# Altium schematic sheet Sheet1.SchDoc
size A4; SheetNumber: 1; SheetTotal: 1
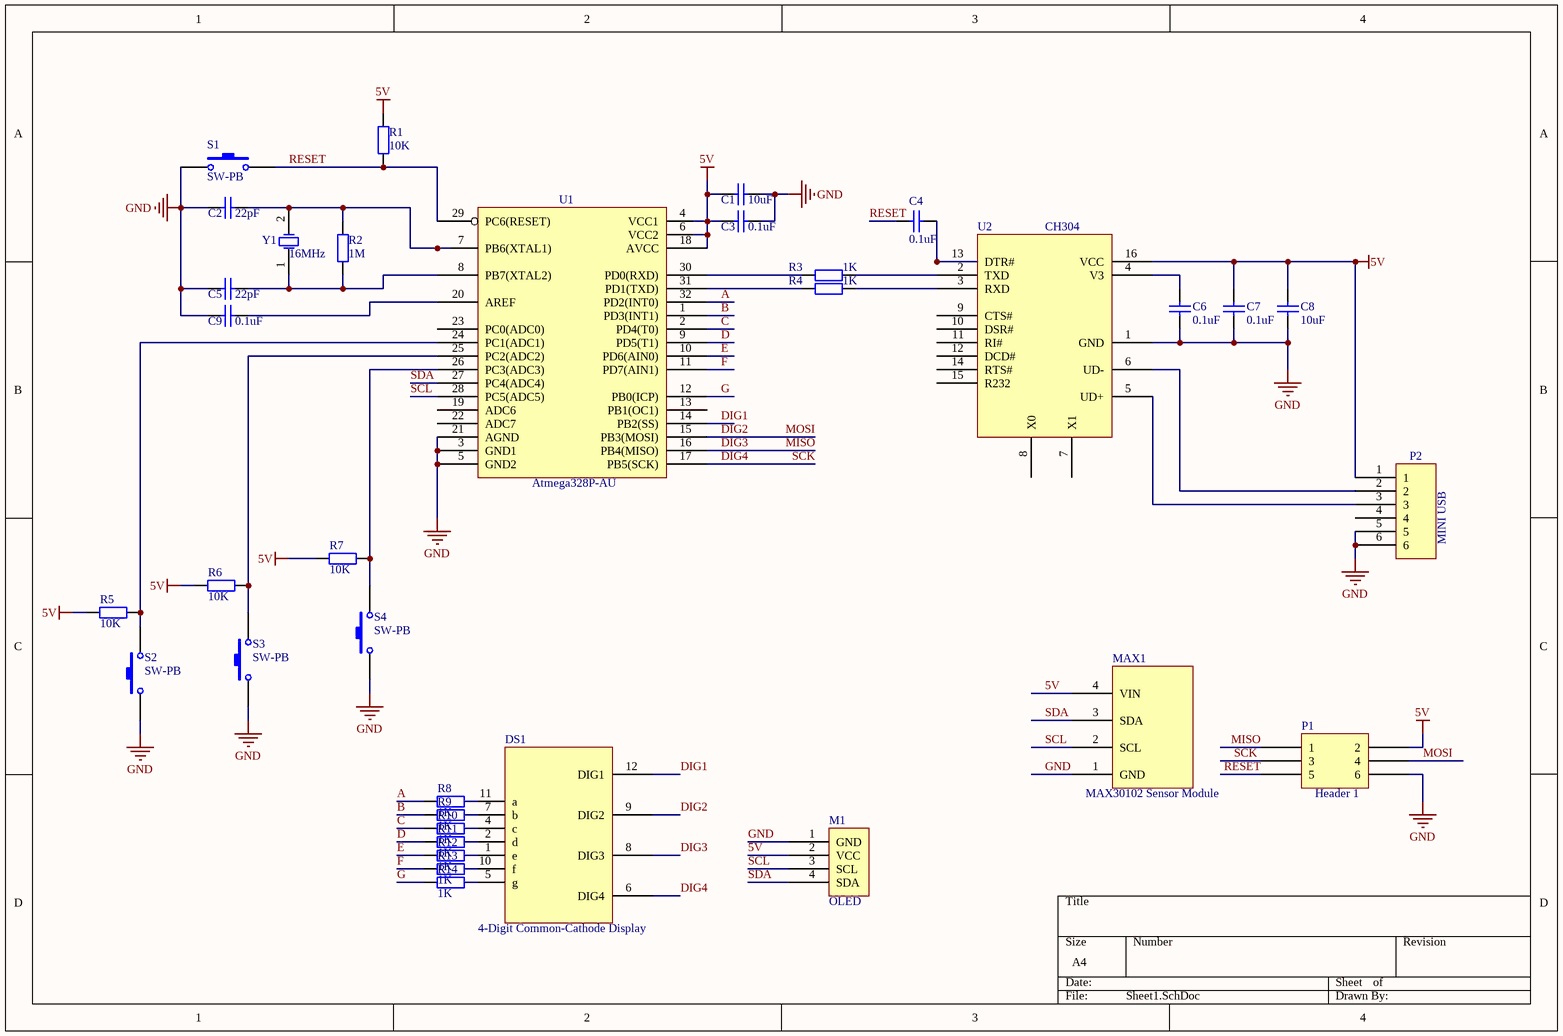
[diagram p0: Sheet1.SchDoc]

## Parts
C1  10uF  [R0805]
C2  22pF  [R0805]
C3  0.1uF  [R0805]
C4  0.1uF  [R0805]
C5  22pF  [R0805]
C6  0.1uF  [R0805]
C7  0.1uF  [R0805]
C8  10uF  [R0805]
C9  0.1uF  [R0805]
CH304  U2  [SO-16]
DS1  4-Digit Common-Cathode Display  [四位数码管]
Header_1  P1  [HDR2X3]
M1  OLED  [HDR1X4]
MAX1  MAX30102 Sensor Module  [血氧模块]
MINI_USB  P2  [USB-MINI3]
R1  value 10K  [R0805]  (hidden comment: Res2)
R2  value 1M  [R0805]  (hidden comment: Res2)
R3  value 1K  [R0805]  (hidden comment: Res2)
R4  value 1K  [R0805]  (hidden comment: Res2)
R5  value 10K  [R0805]  (hidden comment: Res2)
R6  value 10K  [R0805]  (hidden comment: Res2)
R7  value 10K  [R0805]  (hidden comment: Res2)
R8  value 1K  [R0805]  (hidden comment: Res2)
R9  value 1K  [R0805]  (hidden comment: Res2)
R10  value 1K  [R0805]  (hidden comment: Res2)
R11  value 1K  [R0805]  (hidden comment: Res2)
R12  value 1K  [R0805]  (hidden comment: Res2)
R13  value 1K  [R0805]  (hidden comment: Res2)
R14  value 1K  [R0805]  (hidden comment: Res2)
S1  SW-PB  [按钮/SO]
S2  SW-PB  [按钮/SO]
S3  SW-PB  [按钮/SO]
S4  SW-PB  [按钮/SO]
U1  Atmega328P-AU  [LQFP32]
Y1  16MHz  [49SMD]

## Nets
5V: C1.2 C3.2 C7.2 C8.2 CH304.16(VCC) Header_1.2 M1.2(VCC) MAX1.4(VIN) MINI_USB.1 R1.2 R5.2 R6.2 R7.2 U1.4(VCC1) U1.6(VCC2) U1.18(AVCC)
GND: C1.1 C2.2 C3.1 C5.2 C6.1 C7.1 C8.1 C9.2 CH304.1(GND) Header_1.6 M1.1(GND) MAX1.1(GND) MINI_USB.5 MINI_USB.6 S1.1 S2.1 S3.1 S4.1 U1.3(GND1) U1.5(GND2) U1.21(AGND)
A: R8.1 U1.32(PD2(INT0))
B: R9.1 U1.1(PD3(INT1))
C: R10.1 U1.2(PD4(T0))
D: R11.1 U1.9(PD5(T1))
DIG1: DS1.12(DIG1) U1.14(PB2(SS))
DIG2: DS1.9(DIG2) Header_1.4 U1.15(PB3(MOSI))  [also labelled MOSI]
DIG3: DS1.8(DIG3) Header_1.1 U1.16(PB4(MISO))  [also labelled MISO]
DIG4: DS1.6(DIG4) Header_1.3 U1.17(PB5(SCK))  [also labelled SCK]
E: R12.1 U1.10(PD6(AIN0))
F: R13.1 U1.11(PD7(AIN1))
G: R14.1 U1.12(PB0(ICP))
RESET: C4.2 Header_1.5 R1.1 S1.2 U1.29(PC6(RESET))
SCL: M1.3(SCL) MAX1.2(SCL) U1.28(PC5(ADC5))
SDA: M1.4(SDA) MAX1.3(SDA) U1.27(PC4(ADC4))
NetC2_1: C2.1 R2.2 U1.7(PB6(XTAL1)) Y1.2(OSC2)
NetC4_1: C4.1 CH304.13(DTR#)
NetC5_1: C5.1 R2.1 U1.8(PB7(XTAL2)) Y1.1(OSC1)
NetC6_2: C6.2 CH304.4(V3)
NetC9_1: C9.1 U1.20(AREF)
NetCH304_2: CH304.2(TXD) R3.2
NetCH304_3: CH304.3(RXD) R4.2
NetCH304_5: CH304.5(UD+) MINI_USB.3
NetCH304_6: CH304.6(UD-) MINI_USB.2
NetDS1_1: DS1.1(e) R12.2
NetDS1_2: DS1.2(d) R11.2
NetDS1_4: DS1.4(c) R10.2
NetDS1_5: DS1.5(g) R14.2
NetDS1_7: DS1.7(b) R9.2
NetDS1_10: DS1.10(f) R13.2
NetDS1_11: DS1.11(a) R8.2
NetR3_1: R3.1 U1.30(PD0(RXD))
NetR4_1: R4.1 U1.31(PD1(TXD))
NetR5_1: R5.1 S2.2 U1.24(PC1(ADC1))
NetR6_1: R6.1 S3.2 U1.25(PC2(ADC2))
NetR7_1: R7.1 S4.2 U1.26(PC3(ADC3))

Not connected (* = marked no-connect by the designer): CH304 7(X1) 8(X0) 9(CTS#) 10(DSR#) 11(RI#) 12(DCD#) 14(RTS#) 15(R232); MINI_USB 4; U1 13(PB1(OC1)) 19(ADC6) 22(ADC7) 23(PC0(ADC0))

## Library data of the parts
C1-C9 = Cap: Capacitor; Published: 8-Jun-2000; LatestRevisionDate: 17-Jul-2002; LatestRevisionNote: Re-released for DXP Platform.; PackageReference: RAD-0.3; Publisher: Altium Limited; PackageDescription: Radial Cap, Thru-Hole; 2 Leads; 0.3 in Pin Spacing
  C1 C8: Value: 10uF
  C2 C5: Value: 22pF
  C3 C4 C6 C7 C9: Value: 0.1uF
CH304 = CH340C
DS1 = DS1
Header_1 = Header 3X2
M1 = M1
MAX1 = MAX30102
MINI_USB = Header6
R1-R14 = Res2: Resistor; Published: 8-Jun-2000; LatestRevisionDate: 17-Jul-2002; LatestRevisionNote: Re-released for DXP Platform.; PackageReference: AXIAL-0.4; Publisher: Altium Limited; PackageDescription: Axial Device, Thru-Hole; 2 Leads; 0.4 in Pin Spacing
S1-S4 = SW-PB: Switch; Published: 24-Mar-1999; LatestRevisionDate: 17-Jul-2002; LatestRevisionNote: Re-released for DXP Platform.; PackageReference: SPST-2; Publisher: Altium Limited; PackageDescription: Switch; 2 Leads
Y1 = XTAL: Crystal Oscillator; Published: 8-Jun-2000; LatestRevisionDate: 17-Jul-2002; LatestRevisionNote: Re-released for DXP Platform.; PackageReference: R38; Publisher: Altium Limited; PackageDescription: Crystal, Thru-Hole; 2 Leads; Body 3.1 x 8.2 mm (Dia.xH)